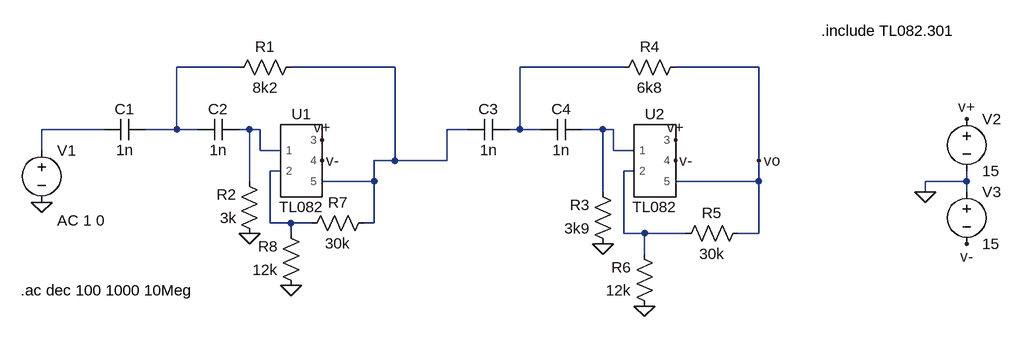
[diagram p0: schematic pasa alto.asc]
pasa alto.asc, the LTspice schematic file:
Version 4.1
SHEET 1 1288 680
WIRE 112 0 16 0
WIRE 352 0 192 0
WIRE 704 0 544 0
WIRE 912 0 784 0
WIRE -96 96 -192 96
WIRE 16 96 16 0
WIRE 16 96 -32 96
WIRE 48 96 16 96
WIRE 128 96 112 96
WIRE 144 96 128 96
WIRE 464 96 432 96
WIRE 544 96 544 0
WIRE 544 96 528 96
WIRE 576 96 544 96
WIRE 672 96 640 96
WIRE 688 96 672 96
WIRE -192 128 -192 96
WIRE 144 128 144 96
WIRE 176 128 144 128
WIRE 688 128 688 96
WIRE 720 128 688 128
WIRE 352 144 352 0
WIRE 352 144 320 144
WIRE 432 144 432 96
WIRE 432 144 352 144
WIRE 912 144 912 0
WIRE 176 160 160 160
WIRE 720 160 704 160
WIRE 128 176 128 96
WIRE 320 176 320 144
WIRE 320 176 240 176
WIRE 912 176 912 144
WIRE 912 176 784 176
WIRE 1232 176 1232 160
WIRE 1232 176 1168 176
WIRE 672 192 672 96
WIRE 1168 192 1168 176
WIRE 1232 192 1232 176
WIRE 160 240 160 160
WIRE 192 240 160 240
WIRE 224 240 192 240
WIRE 320 240 320 176
WIRE 320 240 304 240
WIRE 192 256 192 240
WIRE 704 256 704 160
WIRE 736 256 704 256
WIRE 800 256 736 256
WIRE 912 256 912 176
WIRE 912 256 880 256
WIRE 736 288 736 256
FLAG 128 256 0
FLAG 672 272 0
FLAG -192 208 0
FLAG 1232 80 v+
FLAG 1232 272 v-
FLAG 912 144 vo
FLAG 736 368 0
FLAG 192 336 0
FLAG 1168 192 0
FLAG 240 144 v-
FLAG 784 144 v-
FLAG 784 112 v+
FLAG 240 112 v+
SYMBOL cap -32 80 R90
WINDOW 0 0 32 VBottom 2
WINDOW 3 32 32 VTop 2
SYMATTR InstName C1
SYMATTR Value 1n
SYMBOL cap 112 80 R90
WINDOW 0 0 32 VBottom 2
WINDOW 3 32 32 VTop 2
SYMATTR InstName C2
SYMATTR Value 1n
SYMBOL cap 528 80 R90
WINDOW 0 0 32 VBottom 2
WINDOW 3 32 32 VTop 2
SYMATTR InstName C3
SYMATTR Value 1n
SYMBOL cap 640 80 R90
WINDOW 0 0 32 VBottom 2
WINDOW 3 32 32 VTop 2
SYMATTR InstName C4
SYMATTR Value 1n
SYMBOL res 208 -16 R90
WINDOW 0 0 56 VBottom 2
WINDOW 3 32 56 VTop 2
SYMATTR InstName R1
SYMATTR Value 8k2
SYMBOL res 144 272 R180
WINDOW 0 36 76 Left 2
WINDOW 3 36 40 Left 2
SYMATTR InstName R2
SYMATTR Value 3k
SYMBOL res 688 288 R180
WINDOW 0 36 76 Left 2
WINDOW 3 36 40 Left 2
SYMATTR InstName R3
SYMATTR Value 3k9
SYMBOL res 688 16 R270
WINDOW 0 32 56 VTop 2
WINDOW 3 0 56 VBottom 2
SYMATTR InstName R4
SYMATTR Value 6k8
SYMBOL voltage -192 112 R0
WINDOW 123 24 124 Left 2
WINDOW 39 0 0 Left 0
SYMATTR Value2 AC 1 0
SYMATTR InstName V1
SYMATTR Value ""
SYMBOL voltage 1232 64 R0
WINDOW 123 0 0 Left 0
WINDOW 39 0 0 Left 0
SYMATTR InstName V2
SYMATTR Value 15
SYMBOL voltage 1232 176 R0
WINDOW 123 0 0 Left 0
WINDOW 39 0 0 Left 0
SYMATTR InstName V3
SYMATTR Value 15
SYMBOL res 896 240 R90
WINDOW 0 0 56 VBottom 2
WINDOW 3 32 56 VTop 2
SYMATTR InstName R5
SYMATTR Value 30k
SYMBOL res 752 384 R180
WINDOW 0 36 76 Left 2
WINDOW 3 36 40 Left 2
SYMATTR InstName R6
SYMATTR Value 12k
SYMBOL res 320 224 R90
WINDOW 0 0 56 VBottom 2
WINDOW 3 32 56 VTop 2
SYMATTR InstName R7
SYMATTR Value 30k
SYMBOL res 208 352 R180
WINDOW 0 36 76 Left 2
WINDOW 3 36 40 Left 2
SYMATTR InstName R8
SYMATTR Value 12k
SYMBOL TL082 208 144 R0
SYMATTR InstName U1
SYMBOL TL082 752 144 R0
SYMATTR InstName U2
TEXT -224 344 Left 2 !.ac dec 100 1000 10Meg
TEXT 1008 -56 Left 2 !.include TL082.301

The netlist it stands for:
* pasa alto.asc
C1 N001 N004 1n
C2 N005 N001 1n
C3 N003 N002 1n
C4 N006 N003 1n
R1 N002 N001 8k2
R2 0 N005 3k
R3 0 N006 3k9
R4 N003 vo 6k8
V1 N004 0 AC 1 0
V2 v+ 0 15
V3 0 v- 15
R5 vo N008 30k
R6 0 N008 12k
R7 N002 N007 30k
R8 0 N007 12k
X§U1 N005 N007 v+ v- N002 TL082  ; pins 1 2 3 4 5
X§U2 N006 N008 v+ v- vo TL082  ; pins 1 2 3 4 5
.ac dec 100 1000 10Meg
.include TL082.301
.lib TL082.301
.backanno
.end